# Altium schematic sheet Ground.SchDoc: Minus komponentow
size A3; Organization: Altium Limited; Address1: L3, 12a Rodborough Rd; Address2: Frenchs Forest; Address3: NSW; Address4: Australia 2086
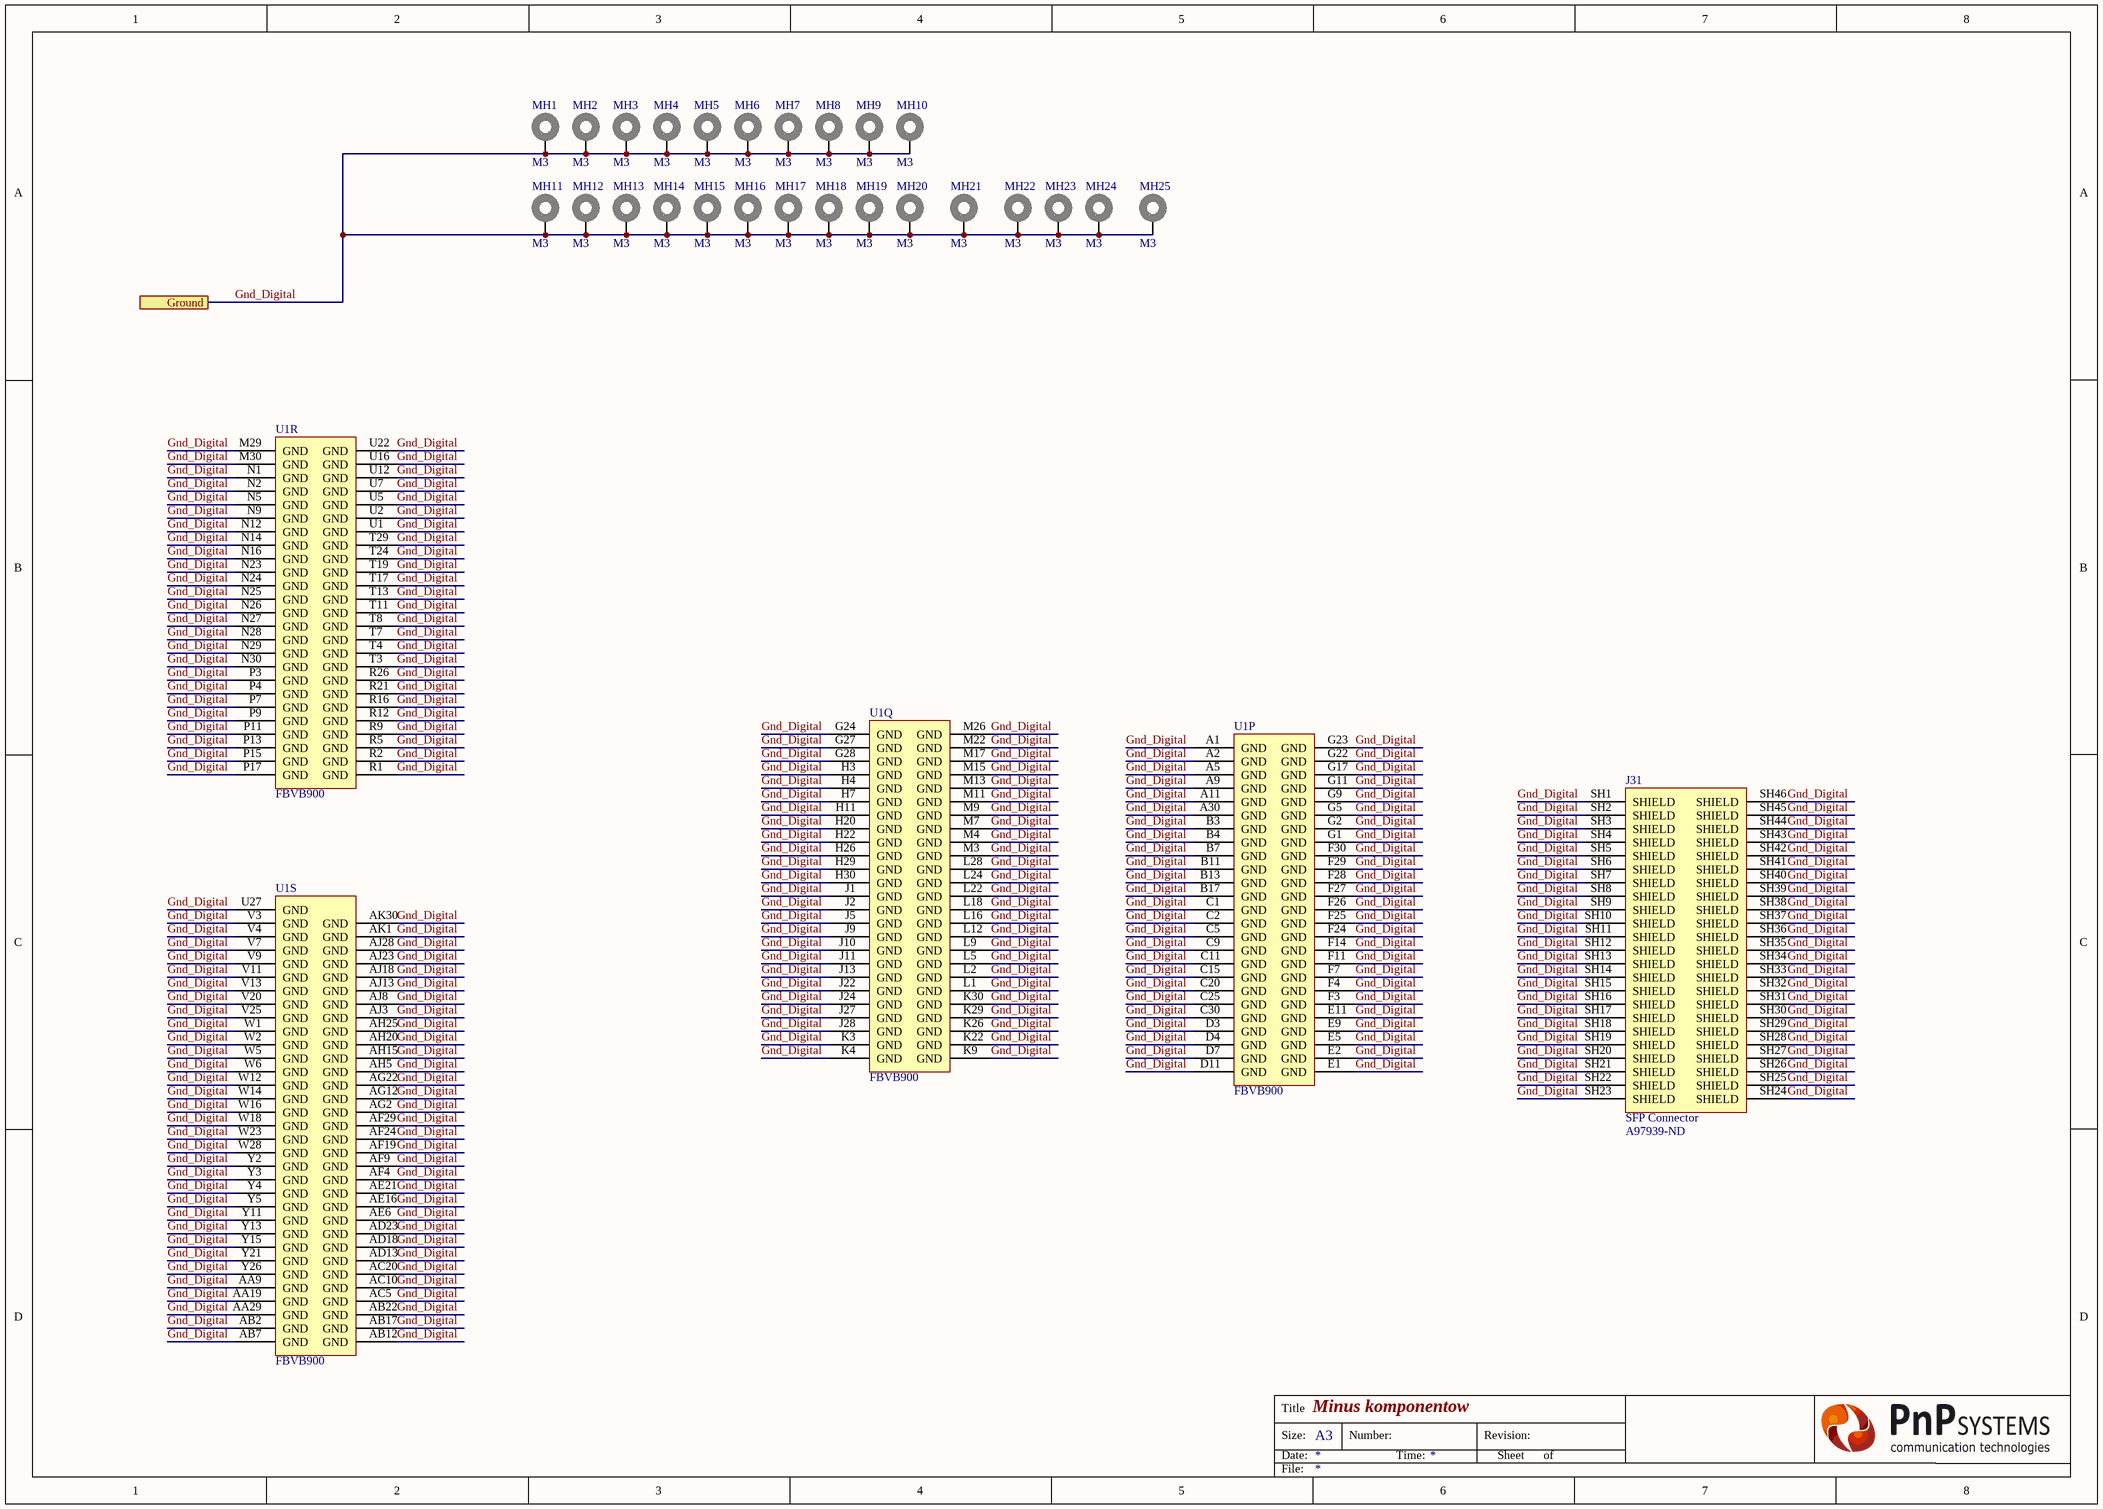
[diagram p0: Ground.SchDoc]

## Parts
J31  SFP Connector  Supplier Part Number 1: A97939-ND  [2007132]
MH1  Parameter 1: M3  [MH_5_3.2_SUB_VIA]  (hidden comment: MH_5_3.2)  (no BOM)
MH2  Parameter 1: M3  [MH_5_3.2_SUB_VIA]  (hidden comment: MH_5_3.2)  (no BOM)
MH3  Parameter 1: M3  [MH_5_3.2_SUB_VIA]  (hidden comment: MH_5_3.2)  (no BOM)
MH4  Parameter 1: M3  [MH_5_3.2_SUB_VIA]  (hidden comment: MH_5_3.2)  (no BOM)
MH5  Parameter 1: M3  [MH_5_3.2_SUB_VIA]  (hidden comment: MH_5_3.2)  (no BOM)
MH6  Parameter 1: M3  [MH_5_3.2_SUB_VIA]  (hidden comment: MH_5_3.2)  (no BOM)
MH7  Parameter 1: M3  [MH_5_3.2_SUB_VIA]  (hidden comment: MH_5_3.2)  (no BOM)
MH8  Parameter 1: M3  [MH_5_3.2_SUB_VIA]  (hidden comment: MH_5_3.2)  (no BOM)
MH9  Parameter 1: M3  [MH_5_3.2_SUB_VIA]  (hidden comment: MH_5_3.2)  (no BOM)
MH10  Parameter 1: M3  [MH_5_3.2_SUB_VIA]  (hidden comment: MH_5_3.2)  (no BOM)
MH11  Parameter 1: M3  [MH_5_3.2_SUB_VIA]  (hidden comment: MH_5_3.2)  (no BOM)
MH12  Parameter 1: M3  [MH_5_3.2_SUB_VIA]  (hidden comment: MH_5_3.2)  (no BOM)
MH13  Parameter 1: M3  [MH_5_3.2_SUB_VIA]  (hidden comment: MH_5_3.2)  (no BOM)
MH14  Parameter 1: M3  [MH_5_3.2_SUB_VIA]  (hidden comment: MH_5_3.2)  (no BOM)
MH15  Parameter 1: M3  [MH_5_3.2_SUB_VIA]  (hidden comment: MH_5_3.2)  (no BOM)
MH16  Parameter 1: M3  [MH_5_3.2_SUB_VIA]  (hidden comment: MH_5_3.2)  (no BOM)
MH17  Parameter 1: M3  [MH_5_3.2_SUB_VIA]  (hidden comment: MH_5_3.2)  (no BOM)
MH18  Parameter 1: M3  [MH_5_3.2_SUB_VIA]  (hidden comment: MH_5_3.2)  (no BOM)
MH19  Parameter 1: M3  [MH_5_3.2_SUB_VIA]  (hidden comment: MH_5_3.2)  (no BOM)
MH20  Parameter 1: M3  [MH_5_3.2_SUB_VIA]  (hidden comment: MH_5_3.2)  (no BOM)
MH21  Parameter 1: M3  [MH_5_3.2_SUB_VIA]  (hidden comment: MH_5_3.2)  (no BOM)
MH22  Parameter 1: M3  [MH_5_3.2_SUB_VIA]  (hidden comment: MH_5_3.2)  (no BOM)
MH23  Parameter 1: M3  [MH_5_3.2_SUB_VIA]  (hidden comment: MH_5_3.2)  (no BOM)
MH24  Parameter 1: M3  [MH_5_3.2_SUB_VIA]  (hidden comment: MH_5_3.2)  (no BOM)
MH25  Parameter 1: M3  [MH_5_3.2_SUB_VIA]  (hidden comment: MH_5_3.2)  (no BOM)
U1  FBVB900  [FBVB900 XX]  (parts P,Q,R,S of 23)

## Ports
Ground

## Nets
Gnd_Digital: J31.SH1(SHIELD) J31.SH2(SHIELD) J31.SH3(SHIELD) J31.SH4(SHIELD) J31.SH5(SHIELD) J31.SH6(SHIELD) J31.SH7(SHIELD) J31.SH8(SHIELD) J31.SH9(SHIELD) J31.SH10(SHIELD) J31.SH11(SHIELD) J31.SH12(SHIELD) J31.SH13(SHIELD) J31.SH14(SHIELD) J31.SH15(SHIELD) J31.SH16(SHIELD) J31.SH17(SHIELD) J31.SH18(SHIELD) J31.SH19(SHIELD) J31.SH20(SHIELD) J31.SH21(SHIELD) J31.SH22(SHIELD) J31.SH23(SHIELD) J31.SH24(SHIELD) J31.SH25(SHIELD) J31.SH26(SHIELD) J31.SH27(SHIELD) J31.SH28(SHIELD) J31.SH29(SHIELD) J31.SH30(SHIELD) J31.SH31(SHIELD) J31.SH32(SHIELD) J31.SH33(SHIELD) J31.SH34(SHIELD) J31.SH35(SHIELD) J31.SH36(SHIELD) J31.SH37(SHIELD) J31.SH38(SHIELD) J31.SH39(SHIELD) J31.SH40(SHIELD) J31.SH41(SHIELD) J31.SH42(SHIELD) J31.SH43(SHIELD) J31.SH44(SHIELD) J31.SH45(SHIELD) J31.SH46(SHIELD) MH1.1 MH2.1 MH3.1 MH4.1 MH5.1 MH6.1 MH7.1 MH8.1 MH9.1 MH10.1 MH11.1 MH12.1 MH13.1 MH14.1 MH15.1 MH16.1 MH17.1 MH18.1 MH19.1 MH20.1 MH21.1 MH22.1 MH23.1 MH24.1 MH25.1 U1.A1(GND) U1.A2(GND) U1.A5(GND) U1.A9(GND) U1.A11(GND) U1.A30(GND) U1.AA9(GND) U1.AA19(GND) U1.AA29(GND) U1.AB2(GND) U1.AB7(GND) U1.AB12(GND) U1.AB17(GND) U1.AB22(GND) U1.AC5(GND) U1.AC10(GND) U1.AC20(GND) U1.AD13(GND) U1.AD18(GND) U1.AD23(GND) U1.AE6(GND) U1.AE16(GND) U1.AE21(GND) U1.AF4(GND) U1.AF9(GND) U1.AF19(GND) U1.AF24(GND) U1.AF29(GND) U1.AG2(GND) U1.AG12(GND) U1.AG22(GND) U1.AH5(GND) U1.AH15(GND) U1.AH20(GND) U1.AH25(GND) U1.AJ3(GND) U1.AJ8(GND) U1.AJ13(GND) U1.AJ18(GND) U1.AJ23(GND) U1.AJ28(GND) U1.AK1(GND) U1.AK30(GND) U1.B3(GND) U1.B4(GND) U1.B7(GND) U1.B11(GND) U1.B13(GND) U1.B17(GND) U1.C1(GND) U1.C2(GND) U1.C5(GND) U1.C9(GND) U1.C11(GND) U1.C15(GND) U1.C20(GND) U1.C25(GND) U1.C30(GND) U1.D3(GND) U1.D4(GND) U1.D7(GND) U1.D11(GND) U1.E1(GND) U1.E2(GND) U1.E5(GND) U1.E9(GND) U1.E11(GND) U1.F3(GND) U1.F4(GND) U1.F7(GND) U1.F11(GND) U1.F14(GND) U1.F24(GND) U1.F25(GND) U1.F26(GND) U1.F27(GND) U1.F28(GND) U1.F29(GND) U1.F30(GND) U1.G1(GND) U1.G2(GND) U1.G5(GND) U1.G9(GND) U1.G11(GND) U1.G17(GND) U1.G22(GND) U1.G23(GND) U1.G24(GND) U1.G27(GND) U1.G28(GND) U1.H3(GND) U1.H4(GND) U1.H7(GND) U1.H11(GND) U1.H20(GND) U1.H22(GND) U1.H26(GND) U1.H29(GND) U1.H30(GND) U1.J1(GND) U1.J2(GND) U1.J5(GND) U1.J9(GND) U1.J10(GND) U1.J11(GND) U1.J13(GND) U1.J22(GND) U1.J24(GND) U1.J27(GND) U1.J28(GND) U1.K3(GND) U1.K4(GND) U1.K9(GND) U1.K22(GND) U1.K26(GND) U1.K29(GND) U1.K30(GND) U1.L1(GND) U1.L2(GND) U1.L5(GND) U1.L9(GND) U1.L12(GND) U1.L16(GND) U1.L18(GND) U1.L22(GND) U1.L24(GND) U1.L28(GND) U1.M3(GND) U1.M4(GND) U1.M7(GND) U1.M9(GND) U1.M11(GND) U1.M13(GND) U1.M15(GND) U1.M17(GND) U1.M22(GND) U1.M26(GND) U1.M29(GND) U1.M30(GND) U1.N1(GND) U1.N2(GND) U1.N5(GND) U1.N9(GND) U1.N12(GND) U1.N14(GND) U1.N16(GND) U1.N23(GND) U1.N24(GND) U1.N25(GND) U1.N26(GND) U1.N27(GND) U1.N28(GND) U1.N29(GND) U1.N30(GND) U1.P3(GND) U1.P4(GND) U1.P7(GND) U1.P9(GND) U1.P11(GND) U1.P13(GND) U1.P15(GND) U1.P17(GND) U1.R1(GND) U1.R2(GND) U1.R5(GND) U1.R9(GND) U1.R12(GND) U1.R16(GND) U1.R21(GND) U1.R26(GND) U1.T3(GND) U1.T4(GND) U1.T7(GND) U1.T8(GND) U1.T11(GND) U1.T13(GND) U1.T17(GND) U1.T19(GND) U1.T24(GND) U1.T29(GND) U1.U1(GND) U1.U2(GND) U1.U5(GND) U1.U7(GND) U1.U12(GND) U1.U16(GND) U1.U22(GND) U1.U27(GND) U1.V3(GND) U1.V4(GND) U1.V7(GND) U1.V9(GND) U1.V11(GND) U1.V13(GND) U1.V20(GND) U1.V25(GND) U1.W1(GND) U1.W2(GND) U1.W5(GND) U1.W6(GND) U1.W12(GND) U1.W14(GND) U1.W16(GND) U1.W18(GND) U1.W23(GND) U1.W28(GND) U1.Y2(GND) U1.Y3(GND) U1.Y4(GND) U1.Y5(GND) U1.Y11(GND) U1.Y13(GND) U1.Y15(GND) U1.Y21(GND) U1.Y26(GND) ; port Ground

## Notes on the sheet
- Title
- Size:
- Date:
- A3
- Number:
- Time:
- Revision:
- Sheet
- of
- File:

## Library data of the parts
J31 = 2007132: Manufacturer: TE Connectivity; Manufacturer Part Number: 2007132-1; Gender: Female; Number of Ports: 4; Data Rate: 16Gbps; PCB Thickness: 2.25mm; Tail Length: 2.05mm; Supplier 1: Digi-Key; Stock 1: 509; Pricing 1: 1 = 12,92000, 10 = 11,74600, 25 = 11,45240, 50 = 10,57140, 100 = 9,98410, 250 = 9,10312, 500 = 8,51582, 1000 = 7,81106 (USD); RoHS: Yes; Mount: Through Hole; Material: Silver; Housing Material: Silver; Packaging: Tray; Package Quantity: 16; Termination: Press-Fit; Connector Type: SFP; Orientation: Right Angle; Features: Shielded; Length: 57.25mm; Depth: 47.8mm; Radiation Hardening: No; Lead Free: Not Applicable; REACH SVHC: No SVHC; ELV: Compliant; Flammability Rating: UL94 V-0; ComponentLink1URL: https://datasheet.ciiva.com/8074/1702641-8074723.pdf?src-supplier=Element14; ComponentLink1Description: https://datasheet.ciiva.com/8074/1702641-8074723.pdf?src-supplier=Element14; ComponentLink2URL: https://datasheet.ciiva.com/16354/2007132-1-16354359.pdf?src-supplier=Future+Electronics; ComponentLink2Description: https://datasheet.ciiva.com/16354/2007132-1-16354359.pdf?src-supplier=Future+Electronics; ComponentLink3URL: https://datasheet.ciiva.com/1447/1744756-1447853.pdf?src-supplier=Newark; ComponentLink3Description: https://datasheet.ciiva.com/1447/1744756-1447853.pdf?src-supplier=Newark; ComponentLink4URL: https://datasheet.ciiva.com/689/eng-cd-2007132-d1-pdf-2007132-c-drw-689518.pdf?src-supplier=Digi-Key; ComponentLink4Description: https://datasheet.ciiva.com/689/eng-cd-2007132-d1-pdf-2007132-c-drw-689518.pdf?src-supplier=Digi-Key; ComponentLink5URL: https://datasheet.ciiva.com/3093/eng-cs-1773408-1-pluggable-ixo-solutions-sfp2b-0209-3093041.pdf?src-supplier=Avnet; ComponentLink5Description: https://datasheet.ciiva.com/3093/eng-cs-1773408-1-pluggable-ixo-solutions-sfp2b-0209-3093041.pdf?src-supplier=Avnet; ComponentLink6URL: https://datasheet.ciiva.com/30089/o-solut-30089223.pdf?src-supplier=Onlinecomponents.com; ComponentLink6Description: https://datasheet.ciiva.com/30089/o-solut-30089223.pdf?src-supplier=Onlinecomponents.com; ComponentLink7URL: https://datasheet.ciiva.com/16775/eng-cs-1773408-1-pluggable-ixo-solutions-sfp2b-0209-16775672.pdf?src-supplier=Avnet+Europe; ComponentLink7Description: https://datasheet.ciiva.com/16775/eng-cs-1773408-1-pluggable-ixo-solutions-sfp2b-0209-16775672.pdf?src-supplier=Avnet+Europe
MH1-MH25 = MH_5_3.2: Mounting Holes_5_3.2
U1 = FBVB900: FPGA Zynq UltraScale+ Family 192150 Cells 20nm Technology 0.85V 900-Pin FCBGA Tray; Manufacturer Part Number: XCZU4CG-1FBVB900E; Manufacturer: Xilinx; Peripherals: WDT,DMA; Interface: I2C,SPI,USB,Ethernet,MMC,SDIO,SD,UART,USART,EBI/EMI; Core Architecture: ARM; RAM Size: 256KB; Frequency: 500MHz; Number of I/Os: 204; Supplier 1: Mouser; Supplier Part Number 1: 217-CZU4CG-1FBVB900E; Stock 1: 3; Pricing 1: 1=0,00000, 5=1060,70000 (USD); RoHS: No; Case/Package: FCBGA; Min Operating Temperature: 0°C; Max Operating Temperature: 100°C; Packaging: Tray; ComponentLink1URL: https://www.xilinx.com/support/documentation/data_sheets/ds891-zynq-ultrascale-plus-overview.pdf?src-supplier=Digi-Key; ComponentLink1Description: https://www.xilinx.com/support/documentation/data_sheets/ds891-zynq-ultrascale-plus-overview.pdf?src-supplier=Digi-Key; ComponentLink2URL: https://www.xilinx.com/support/documentation/data_sheets/ds925-zynq-ultrascale-plus.pdf?src-supplier=Digi-Key; ComponentLink2Description: https://www.xilinx.com/support/documentation/data_sheets/ds925-zynq-ultrascale-plus.pdf?src-supplier=Digi-Key; Supplier 2: Avnet; Supplier 3: Digi-Key; Supplier Part Number 2: XCZU4CG-1FBVB900E; Supplier Part Number 3: XCZU4CG-1FBVB900E-ND